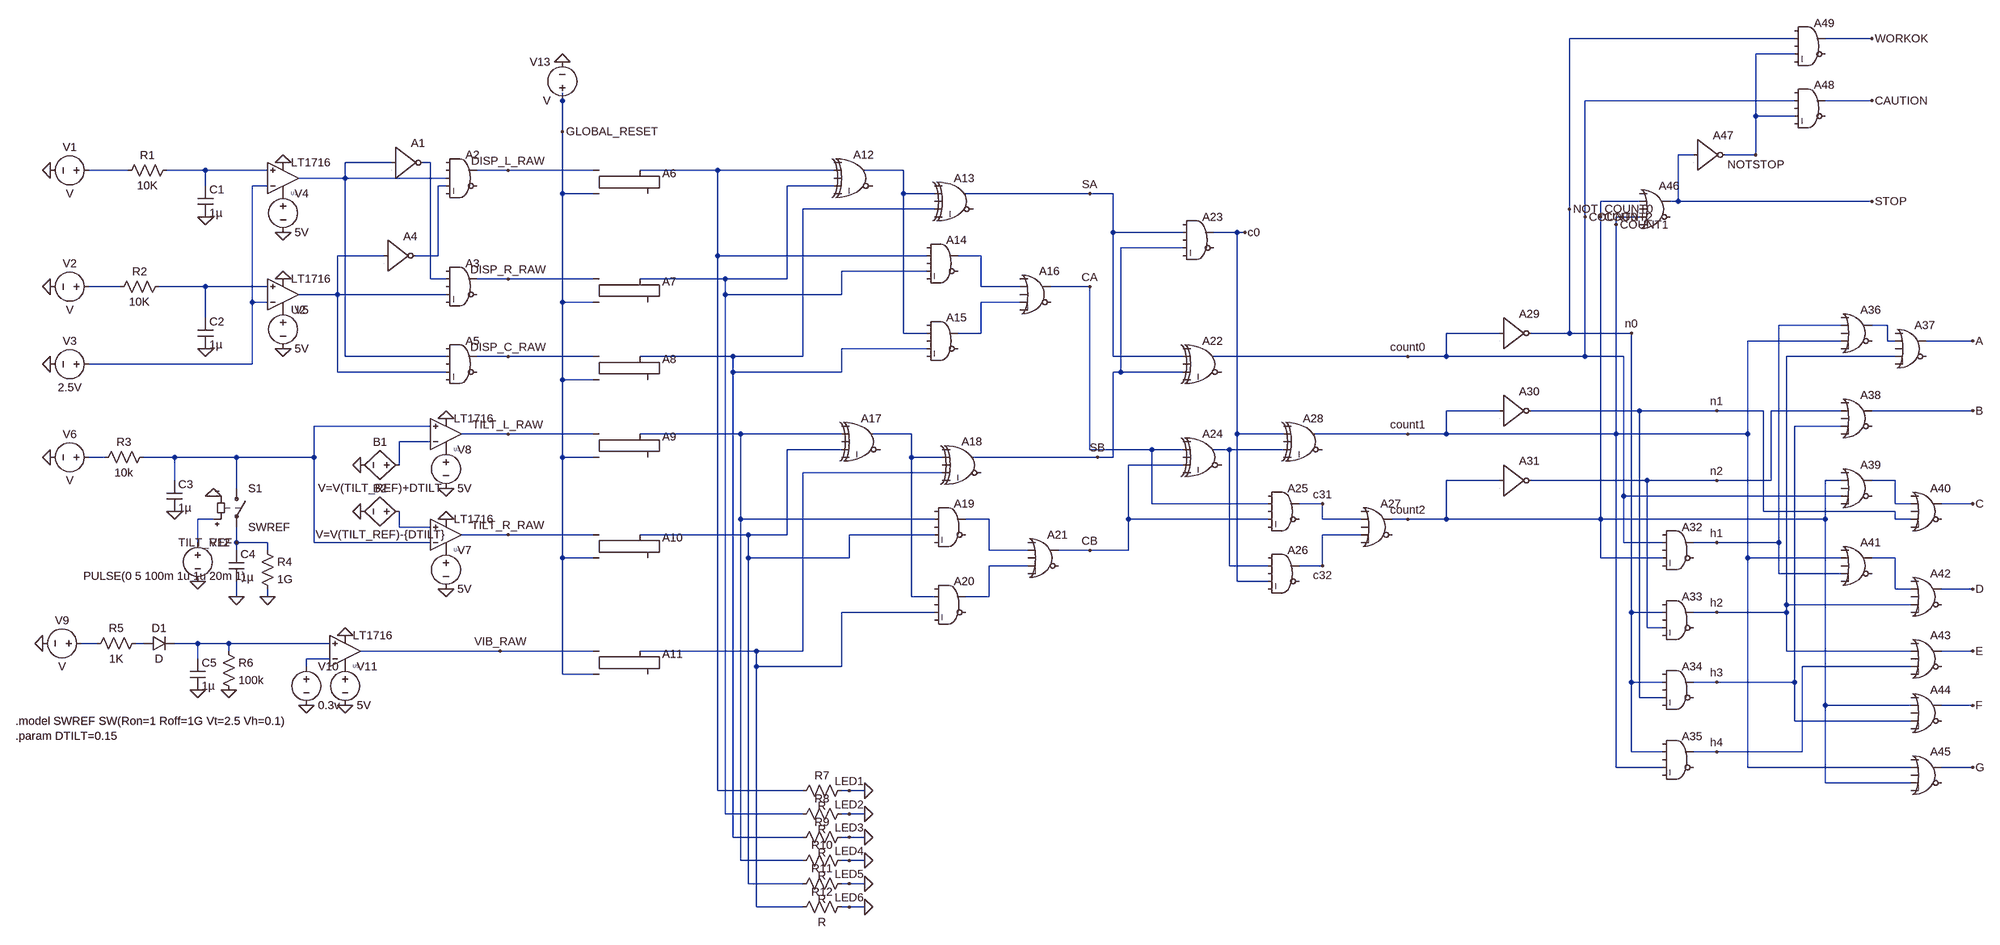
[diagram p0: schematic risk_circuit.asc]
risk_circuit.asc, the LTspice schematic file:
Version 4.1
SHEET 1 4020 1556
WIRE 3632 -272 3168 -272
WIRE 3792 -272 3696 -272
WIRE 3632 -240 3552 -240
WIRE 992 -144 992 -160
WIRE 3632 -144 3200 -144
WIRE 3792 -144 3696 -144
WIRE 3552 -112 3552 -240
WIRE 3632 -112 3552 -112
WIRE 992 -80 992 -144
WIRE 3424 -32 3392 -32
WIRE 3552 -32 3552 -112
WIRE 3552 -32 3488 -32
WIRE 640 -16 544 -16
WIRE 720 -16 704 -16
WIRE 96 0 16 0
WIRE 256 0 176 0
WIRE 384 0 256 0
WIRE 880 0 816 0
WIRE 1056 0 880 0
WIRE 1312 0 1152 0
WIRE 1552 0 1312 0
WIRE 1696 0 1616 0
WIRE 544 16 544 -16
WIRE 544 16 448 16
WIRE 752 16 544 16
WIRE 256 32 256 0
WIRE 384 32 352 32
WIRE 752 32 736 32
WIRE 1552 32 1456 32
WIRE 992 48 992 -80
WIRE 1056 48 992 48
WIRE 1696 48 1696 0
WIRE 1760 48 1696 48
WIRE 2080 48 1824 48
WIRE 2128 48 2080 48
WIRE 3312 64 3232 64
WIRE 3392 64 3392 -32
WIRE 3392 64 3376 64
WIRE 3792 64 3392 64
WIRE 1760 80 1488 80
WIRE 3168 80 3168 -272
WIRE 3200 96 3200 -144
WIRE 3232 96 3232 64
WIRE 3312 96 3264 96
WIRE 3264 112 3264 96
WIRE 2128 128 2128 48
WIRE 2272 128 2128 128
WIRE 2384 128 2336 128
WIRE 2400 128 2384 128
WIRE 2272 160 2144 160
WIRE 624 176 528 176
WIRE 736 176 736 32
WIRE 736 176 688 176
WIRE 1312 176 1312 0
WIRE 1744 176 1312 176
WIRE 1856 176 1808 176
WIRE 1744 208 1568 208
WIRE 720 224 720 -16
WIRE 752 224 720 224
WIRE 880 224 816 224
WIRE 1056 224 880 224
WIRE 1328 224 1152 224
WIRE 1456 224 1456 32
WIRE 1456 224 1328 224
WIRE 80 240 16 240
WIRE 256 240 160 240
WIRE 384 240 256 240
WIRE 1856 240 1856 176
WIRE 1936 240 1856 240
WIRE 2080 240 2000 240
WIRE 528 256 528 176
WIRE 528 256 448 256
WIRE 752 256 528 256
WIRE 1328 256 1328 224
WIRE 1568 256 1568 208
WIRE 1568 256 1328 256
WIRE 352 272 352 32
WIRE 384 272 352 272
WIRE 992 272 992 48
WIRE 1056 272 992 272
WIRE 1936 272 1856 272
WIRE 256 304 256 240
WIRE 3728 320 3600 320
WIRE 3824 320 3792 320
WIRE 1696 336 1696 48
WIRE 1744 336 1696 336
WIRE 1856 336 1856 272
WIRE 1856 336 1808 336
WIRE 3024 336 2816 336
WIRE 3168 336 3168 80
WIRE 3168 336 3088 336
WIRE 3296 336 3168 336
WIRE 3728 352 3536 352
WIRE 3824 352 3824 320
WIRE 3840 352 3824 352
WIRE 4000 352 3904 352
WIRE 1744 368 1568 368
WIRE 544 384 544 16
WIRE 752 384 544 384
WIRE 880 384 816 384
WIRE 1056 384 880 384
WIRE 1344 384 1152 384
WIRE 1488 384 1488 80
WIRE 1488 384 1344 384
WIRE 2128 384 2128 128
WIRE 2272 384 2128 384
WIRE 2736 384 2336 384
WIRE 2816 384 2816 336
WIRE 2816 384 2736 384
WIRE 3200 384 3200 96
WIRE 3200 384 2816 384
WIRE 3280 384 3200 384
WIRE 3840 384 3616 384
WIRE 352 400 352 272
WIRE 352 400 16 400
WIRE 528 416 528 256
WIRE 752 416 528 416
WIRE 1344 416 1344 384
WIRE 1568 416 1568 368
WIRE 1568 416 1344 416
WIRE 2144 416 2144 160
WIRE 2144 416 2128 416
WIRE 2272 416 2144 416
WIRE 992 432 992 272
WIRE 1056 432 992 432
WIRE 3024 496 2816 496
WIRE 3312 496 3088 496
WIRE 3472 496 3312 496
WIRE 3568 496 3472 496
WIRE 3728 496 3584 496
WIRE 4000 496 3792 496
WIRE 720 528 480 528
WIRE 3728 528 3632 528
WIRE 880 544 784 544
WIRE 1056 544 880 544
WIRE 1360 544 1152 544
WIRE 1568 544 1360 544
WIRE 1712 544 1632 544
WIRE 2384 544 2384 128
WIRE 2480 544 2384 544
WIRE 2736 544 2544 544
WIRE 2816 544 2816 496
WIRE 2816 544 2736 544
WIRE 3264 544 3264 112
WIRE 3264 544 2816 544
WIRE 3536 544 3536 352
WIRE 3536 544 3264 544
WIRE 720 560 656 560
WIRE 1568 576 1456 576
WIRE 2080 576 2080 240
WIRE 2208 576 2080 576
WIRE 2272 576 2208 576
WIRE 2368 576 2336 576
WIRE 2480 576 2368 576
WIRE 48 592 16 592
WIRE 192 592 128 592
WIRE 320 592 192 592
WIRE 480 592 480 528
WIRE 480 592 320 592
WIRE 992 592 992 432
WIRE 1056 592 992 592
WIRE 1712 592 1712 544
WIRE 1776 592 1712 592
WIRE 2096 592 1840 592
WIRE 2128 592 2128 416
WIRE 2128 592 2096 592
WIRE 656 608 656 560
WIRE 2272 608 2160 608
WIRE 1776 624 1488 624
WIRE 192 640 192 592
WIRE 3024 640 2816 640
WIRE 3328 640 3088 640
WIRE 3472 640 3328 640
WIRE 3584 640 3584 496
WIRE 3584 640 3472 640
WIRE 3728 640 3696 640
WIRE 3840 640 3792 640
WIRE 320 656 320 592
WIRE 3280 672 3280 384
WIRE 3728 672 3280 672
WIRE 2208 688 2208 576
WIRE 2448 688 2208 688
WIRE 2560 688 2512 688
WIRE 3840 688 3840 640
WIRE 3872 688 3840 688
WIRE 4000 688 3936 688
WIRE 3568 704 3568 496
WIRE 3840 704 3568 704
WIRE 272 720 240 720
WIRE 1360 720 1360 544
WIRE 1760 720 1360 720
WIRE 1872 720 1824 720
WIRE 2160 720 2160 608
WIRE 2448 720 2160 720
WIRE 2560 720 2560 688
WIRE 2640 720 2560 720
WIRE 2736 720 2704 720
WIRE 2816 720 2816 640
WIRE 2816 720 2736 720
WIRE 3232 720 3232 96
WIRE 3232 720 2816 720
WIRE 3696 720 3696 640
WIRE 3696 720 3232 720
WIRE 3840 720 3840 704
WIRE 3872 720 3840 720
WIRE 656 736 656 704
WIRE 720 736 656 736
WIRE 880 752 784 752
WIRE 1056 752 880 752
WIRE 1376 752 1152 752
WIRE 1456 752 1456 576
WIRE 1456 752 1376 752
WIRE 1760 752 1584 752
WIRE 2640 752 2560 752
WIRE 240 768 240 720
WIRE 320 768 320 736
WIRE 384 768 320 768
WIRE 480 768 480 592
WIRE 720 768 480 768
WIRE 3280 768 3280 672
WIRE 3360 768 3280 768
WIRE 3472 768 3424 768
WIRE 3600 768 3600 320
WIRE 3600 768 3472 768
WIRE 320 784 320 768
WIRE 384 784 384 768
WIRE 1872 784 1872 720
WIRE 1952 784 1872 784
WIRE 2080 784 2016 784
WIRE 2160 784 2160 720
WIRE 2160 784 2080 784
WIRE 992 800 992 592
WIRE 1056 800 992 800
WIRE 1376 800 1376 752
WIRE 1584 800 1584 752
WIRE 1584 800 1376 800
WIRE 3232 800 3232 720
WIRE 3360 800 3232 800
WIRE 3536 800 3536 544
WIRE 3728 800 3536 800
WIRE 3840 800 3792 800
WIRE 1952 816 1872 816
WIRE 2368 816 2368 576
WIRE 2448 816 2368 816
WIRE 2560 816 2560 752
WIRE 2560 816 2512 816
WIRE 3600 832 3600 768
WIRE 3728 832 3600 832
WIRE 2384 848 2384 544
WIRE 2448 848 2384 848
WIRE 3840 864 3840 800
WIRE 3872 864 3840 864
WIRE 4000 864 3936 864
WIRE 320 880 320 848
WIRE 384 880 384 864
WIRE 1712 880 1712 592
WIRE 1760 880 1712 880
WIRE 1872 880 1872 816
WIRE 1872 880 1824 880
WIRE 3616 896 3616 384
WIRE 3872 896 3616 896
WIRE 1760 912 1568 912
WIRE 3296 912 3296 336
WIRE 3360 912 3296 912
WIRE 3472 912 3424 912
WIRE 3616 912 3616 896
WIRE 3616 912 3472 912
WIRE 3328 944 3328 640
WIRE 3360 944 3328 944
WIRE 32 976 0 976
WIRE 128 976 112 976
WIRE 240 976 192 976
WIRE 304 976 240 976
WIRE 512 976 304 976
WIRE 304 992 304 976
WIRE 864 992 576 992
WIRE 1056 992 864 992
WIRE 1392 992 1152 992
WIRE 1488 992 1488 624
WIRE 1488 992 1392 992
WIRE 3616 992 3616 912
WIRE 3872 992 3616 992
WIRE 4000 992 3936 992
WIRE 240 1008 240 976
WIRE 512 1008 464 1008
WIRE 464 1024 464 1008
WIRE 1392 1024 1392 992
WIRE 1568 1024 1568 912
WIRE 1568 1024 1392 1024
WIRE 3872 1024 3648 1024
WIRE 992 1040 992 800
WIRE 1056 1040 992 1040
WIRE 3296 1056 3296 912
WIRE 3360 1056 3296 1056
WIRE 3472 1056 3424 1056
WIRE 3632 1056 3632 528
WIRE 3632 1056 3472 1056
WIRE 3312 1088 3312 496
WIRE 3360 1088 3312 1088
WIRE 3696 1104 3696 720
WIRE 3872 1104 3696 1104
WIRE 4000 1104 3936 1104
WIRE 3632 1136 3632 1056
WIRE 3872 1136 3632 1136
WIRE 3296 1200 3296 1056
WIRE 3360 1200 3296 1200
WIRE 3472 1200 3424 1200
WIRE 3648 1200 3648 1024
WIRE 3648 1200 3472 1200
WIRE 3264 1232 3264 544
WIRE 3360 1232 3264 1232
WIRE 3536 1232 3536 800
WIRE 3872 1232 3536 1232
WIRE 4000 1232 3936 1232
WIRE 3696 1264 3696 1104
WIRE 3872 1264 3696 1264
WIRE 1312 1280 1312 176
WIRE 1488 1280 1312 1280
WIRE 1584 1280 1568 1280
WIRE 1616 1280 1584 1280
WIRE 1328 1328 1328 256
WIRE 1488 1328 1328 1328
WIRE 1584 1328 1568 1328
WIRE 1616 1328 1584 1328
WIRE 1344 1376 1344 416
WIRE 1488 1376 1344 1376
WIRE 1584 1376 1568 1376
WIRE 1616 1376 1584 1376
WIRE 1360 1424 1360 720
WIRE 1488 1424 1360 1424
WIRE 1584 1424 1568 1424
WIRE 1616 1424 1584 1424
WIRE 1376 1472 1376 800
WIRE 1488 1472 1376 1472
WIRE 1584 1472 1568 1472
WIRE 1616 1472 1584 1472
WIRE 1392 1520 1392 1024
WIRE 1488 1520 1392 1520
WIRE 1584 1520 1568 1520
WIRE 1616 1520 1584 1520
FLAG -64 0 0
FLAG -64 240 0
FLAG -64 400 0
FLAG 256 368 0
FLAG 256 96 0
FLAG 416 128 0
FLAG 416 368 0
FLAG 416 -16 0
FLAG 416 224 0
FLAG 880 0 DISP_L_RAW
FLAG 880 224 DISP_R_RAW
FLAG 880 384 DISP_C_RAW
FLAG -64 592 0
FLAG 192 704 0
FLAG 320 880 0
FLAG 384 880 0
FLAG 576 608 0
FLAG 576 704 0
FLAG 752 720 0
FLAG 752 512 0
FLAG 464 1104 0
FLAG 544 960 0
FLAG 752 656 0
FLAG 752 864 0
FLAG 240 848 0
FLAG 272 672 0
FLAG 544 1104 0
FLAG -80 976 0
FLAG 240 1072 0
FLAG 304 1072 0
FLAG 864 992 VIB_RAW
FLAG 880 544 TILT_L_RAW
FLAG 880 752 TILT_R_RAW
FLAG 320 768 TILT_REF
FLAG 992 -224 0
FLAG 992 -80 GLOBAL_RESET
FLAG 1584 1280 LED1
FLAG 1584 1328 LED2
FLAG 1584 1376 LED3
FLAG 1584 1424 LED4
FLAG 1584 1472 LED5
FLAG 1584 1520 LED6
FLAG 2080 48 SA
FLAG 2080 240 CA
FLAG 2096 592 SB
FLAG 2080 784 CB
FLAG 2400 128 c0
FLAG 2560 688 c31
FLAG 2560 816 c32
FLAG 2736 384 count0
FLAG 2736 720 count2
FLAG 2736 544 count1
FLAG 3296 336 n0
FLAG 3472 496 n1
FLAG 3472 640 n2
FLAG 3472 768 h1
FLAG 3472 912 h2
FLAG 3472 1056 h3
FLAG 3472 1200 h4
FLAG 4000 352 A
FLAG 4000 496 B
FLAG 4000 688 C
FLAG 4000 864 D
FLAG 4000 992 E
FLAG 4000 1104 F
FLAG 4000 1232 G
FLAG 1616 1280 0
FLAG 1616 1328 0
FLAG 1616 1376 0
FLAG 1616 1424 0
FLAG 1616 1472 0
FLAG 1616 1520 0
FLAG 3792 64 STOP
FLAG 3552 -32 NOTSTOP
FLAG 3792 -144 CAUTION
FLAG 3792 -272 WORKOK
FLAG 3168 80 NOT_COUNT0
FLAG 3200 96 COUNT0
FLAG 3232 96 COUNT2
FLAG 3264 112 COUNT1
SYMBOL voltage 32 0 R90
WINDOW 0 -32 56 VBottom 2
WINDOW 3 32 56 VTop 2
SYMATTR InstName V1
SYMBOL voltage 32 240 R90
WINDOW 0 -32 56 VBottom 2
WINDOW 3 32 56 VTop 2
SYMATTR InstName V2
SYMBOL voltage 32 400 R90
WINDOW 0 -32 56 VBottom 2
WINDOW 3 32 56 VTop 2
WINDOW 123 0 0 Left 0
WINDOW 39 0 0 Left 0
SYMATTR InstName V3
SYMATTR Value 2.5V
SYMBOL res 192 -16 R90
WINDOW 0 0 56 VBottom 2
WINDOW 3 32 56 VTop 2
SYMATTR InstName R1
SYMATTR Value 10K
SYMBOL res 176 224 R90
WINDOW 0 0 56 VBottom 2
WINDOW 3 32 56 VTop 2
SYMATTR InstName R2
SYMATTR Value 10K
SYMBOL cap 240 32 R0
SYMATTR InstName C1
SYMATTR Value 1µ
SYMBOL cap 240 304 R0
SYMATTR InstName C2
SYMATTR Value 1µ
SYMBOL Comparators\\LT1716 416 16 M180
WINDOW 0 16 -32 Left 0
SYMATTR InstName U1
SYMBOL Comparators\\LT1716 416 256 M180
SYMATTR InstName U2
SYMBOL voltage 416 32 R0
WINDOW 123 0 0 Left 0
WINDOW 39 0 0 Left 0
SYMATTR InstName V4
SYMATTR Value 5V
SYMBOL voltage 416 272 R0
WINDOW 123 0 0 Left 0
WINDOW 39 0 0 Left 0
SYMATTR InstName V5
SYMATTR Value 5V
SYMBOL Digital\\inv 640 -80 R0
SYMATTR InstName A1
SYMBOL Digital\\and 784 -48 R0
SYMATTR InstName A2
SYMBOL Digital\\and 784 176 R0
SYMATTR InstName A3
SYMBOL Digital\\inv 624 112 R0
SYMATTR InstName A4
SYMBOL Digital\\and 784 336 R0
SYMATTR InstName A5
SYMBOL voltage 32 592 R90
WINDOW 0 -32 56 VBottom 2
WINDOW 3 32 56 VTop 2
SYMATTR InstName V6
SYMBOL res 144 576 R90
WINDOW 0 0 56 VBottom 2
WINDOW 3 32 56 VTop 2
SYMATTR InstName R3
SYMATTR Value 10k
SYMBOL cap 176 640 R0
SYMATTR InstName C3
SYMATTR Value 1µ
SYMBOL sw 320 640 R0
SYMATTR InstName S1
SYMATTR Value SWREF
SYMBOL cap 304 784 R0
SYMATTR InstName C4
SYMATTR Value 1µ
SYMBOL res 368 768 R0
SYMATTR InstName R4
SYMATTR Value 1G
SYMBOL bv 672 608 R90
WINDOW 0 -32 56 VBottom 2
WINDOW 3 32 56 VTop 2
SYMATTR InstName B1
SYMATTR Value V=V(TILT_REF)+DTILT
SYMBOL bv 672 704 R90
WINDOW 0 -32 56 VBottom 2
WINDOW 3 32 56 VTop 2
SYMATTR InstName B2
SYMATTR Value V=V(TILT_REF)-{DTILT}
SYMBOL Comparators\\LT1716 752 544 M180
WINDOW 0 16 -32 Left 0
SYMATTR InstName U3
SYMBOL Comparators\\LT1716 752 752 M180
WINDOW 0 16 -32 Left 0
SYMATTR InstName U4
SYMBOL voltage 752 768 R0
WINDOW 123 0 0 Left 0
WINDOW 39 0 0 Left 0
SYMATTR InstName V7
SYMATTR Value 5V
SYMBOL voltage 752 560 R0
WINDOW 123 0 0 Left 0
WINDOW 39 0 0 Left 0
SYMATTR InstName V8
SYMATTR Value 5V
SYMBOL voltage 16 976 R90
WINDOW 0 -32 56 VBottom 2
WINDOW 3 32 56 VTop 2
SYMATTR InstName V9
SYMBOL res 128 960 R90
WINDOW 0 0 56 VBottom 2
WINDOW 3 32 56 VTop 2
SYMATTR InstName R5
SYMATTR Value 1K
SYMBOL diode 128 992 R270
WINDOW 0 32 32 VTop 2
WINDOW 3 0 32 VBottom 2
SYMATTR InstName D1
SYMBOL cap 224 1008 R0
SYMATTR InstName C5
SYMATTR Value 1µ
SYMBOL res 288 976 R0
SYMATTR InstName R6
SYMATTR Value 100k
SYMBOL Comparators\\LT1716 544 992 M180
WINDOW 0 16 -32 Left 0
SYMATTR InstName U5
SYMBOL voltage 464 1008 R0
WINDOW 123 0 0 Left 0
WINDOW 39 0 0 Left 0
SYMATTR InstName V10
SYMATTR Value 0.3v
SYMBOL voltage 544 1008 R0
WINDOW 123 0 0 Left 0
WINDOW 39 0 0 Left 0
SYMATTR InstName V11
SYMATTR Value 5V
SYMBOL voltage 240 752 R0
WINDOW 3 -236 85 Left 2
WINDOW 123 0 0 Left 0
WINDOW 39 0 0 Left 0
SYMATTR Value PULSE(0 5 100m 1u 1u 20m 1)
SYMATTR InstName V12
SYMBOL Digital\\srflop 1104 -48 R0
SYMATTR InstName A6
SYMBOL Digital\\srflop 1104 176 R0
SYMATTR InstName A7
SYMBOL Digital\\srflop 1104 336 R0
SYMATTR InstName A8
SYMBOL Digital\\srflop 1104 496 R0
SYMATTR InstName A9
SYMBOL Digital\\srflop 1104 704 R0
SYMATTR InstName A10
SYMBOL Digital\\srflop 1104 944 R0
SYMATTR InstName A11
SYMBOL voltage 992 -128 R180
WINDOW 0 24 96 Left 2
WINDOW 3 24 16 Left 2
SYMATTR InstName V13
SYMBOL res 1584 1264 R90
WINDOW 0 0 56 VBottom 2
WINDOW 3 32 56 VTop 2
SYMATTR InstName R7
SYMBOL res 1584 1312 R90
WINDOW 0 0 56 VBottom 2
WINDOW 3 32 56 VTop 2
SYMATTR InstName R8
SYMBOL res 1584 1360 R90
WINDOW 0 0 56 VBottom 2
WINDOW 3 32 56 VTop 2
SYMATTR InstName R9
SYMBOL res 1584 1408 R90
WINDOW 0 0 56 VBottom 2
WINDOW 3 32 56 VTop 2
SYMATTR InstName R10
SYMBOL res 1584 1456 R90
WINDOW 0 0 56 VBottom 2
WINDOW 3 32 56 VTop 2
SYMATTR InstName R11
SYMBOL res 1584 1504 R90
WINDOW 0 0 56 VBottom 2
WINDOW 3 32 56 VTop 2
SYMATTR InstName R12
SYMBOL Digital\\xor 1600 -48 R0
SYMATTR InstName A12
SYMBOL Digital\\xor 1808 0 R0
SYMATTR InstName A13
SYMBOL Digital\\and 1776 128 R0
SYMATTR InstName A14
SYMBOL Digital\\and 1776 288 R0
SYMATTR InstName A15
SYMBOL Digital\\or 1968 192 R0
SYMATTR InstName A16
SYMBOL Digital\\xor 1616 496 R0
SYMATTR InstName A17
SYMBOL Digital\\xor 1824 544 R0
SYMATTR InstName A18
SYMBOL Digital\\and 1792 672 R0
SYMATTR InstName A19
SYMBOL Digital\\and 1792 832 R0
SYMATTR InstName A20
SYMBOL Digital\\or 1984 736 R0
SYMATTR InstName A21
SYMBOL Digital\\xor 2320 336 R0
SYMATTR InstName A22
SYMBOL Digital\\and 2304 80 R0
SYMATTR InstName A23
SYMBOL Digital\\xor 2320 528 R0
SYMATTR InstName A24
SYMBOL Digital\\and 2480 640 R0
SYMATTR InstName A25
SYMBOL Digital\\and 2480 768 R0
SYMATTR InstName A26
SYMBOL Digital\\or 2672 672 R0
SYMATTR InstName A27
SYMBOL Digital\\xor 2528 496 R0
SYMATTR InstName A28
SYMBOL Digital\\inv 3024 272 R0
SYMATTR InstName A29
SYMBOL Digital\\inv 3024 432 R0
SYMATTR InstName A30
SYMBOL Digital\\inv 3024 576 R0
SYMATTR InstName A31
SYMBOL Digital\\and 3392 720 R0
SYMATTR InstName A32
SYMBOL Digital\\and 3392 864 R0
SYMATTR InstName A33
SYMBOL Digital\\and 3392 1008 R0
SYMATTR InstName A34
SYMBOL Digital\\and 3392 1152 R0
SYMATTR InstName A35
SYMBOL Digital\\or 3760 272 R0
SYMATTR InstName A36
SYMBOL Digital\\or 3872 304 R0
SYMATTR InstName A37
SYMBOL Digital\\or 3760 448 R0
SYMATTR InstName A38
SYMBOL Digital\\or 3760 592 R0
SYMATTR InstName A39
SYMBOL Digital\\or 3904 640 R0
SYMATTR InstName A40
SYMBOL Digital\\or 3760 752 R0
SYMATTR InstName A41
SYMBOL Digital\\or 3904 816 R0
SYMATTR InstName A42
SYMBOL Digital\\or 3904 944 R0
SYMATTR InstName A43
SYMBOL Digital\\or 3904 1056 R0
SYMATTR InstName A44
SYMBOL Digital\\or 3904 1184 R0
SYMATTR InstName A45
SYMBOL Digital\\or 3344 16 R0
SYMATTR InstName A46
SYMBOL Digital\\inv 3424 -96 R0
SYMATTR InstName A47
SYMBOL Digital\\and 3664 -192 R0
SYMATTR InstName A48
SYMBOL Digital\\and 3664 -320 R0
SYMATTR InstName A49
TEXT -136 1136 Left 2 !.model SWREF SW(Ron=1 Roff=1G Vt=2.5 Vh=0.1)\n.param DTILT=0.15

The netlist it stands for:
* risk_circuit.asc
V1 N003 0 V
V2 N013 0 V
V3 N007 0 2.5V
R1 N004 N003 10K
R2 N014 N013 10K
C1 N004 0 1µ
C2 N014 0 1µ
X§U1 N004 N007 P001 0 N001 LT1716  ; pins In+ In- V+ V- OUT
X§U2 N014 N007 P002 0 N011 LT1716  ; pins In+ In- V+ V- OUT
V4 P001 0 5V
V5 P002 0 5V
A1 N001 0 0 0 0 N002 0 0 BUF
A2 0 0 N001 N008 0 0 DISP_L_RAW 0 AND
A3 0 N002 0 N011 0 0 DISP_R_RAW 0 AND
A4 N011 0 0 0 0 N008 0 0 BUF
A5 0 N001 0 N011 0 0 DISP_C_RAW 0 AND
V6 N023 0 V
R3 N017 N023 10k
C3 N017 0 1µ
S1 N017 TILT_REF N026 0 SWREF
C4 TILT_REF 0 1µ
R4 TILT_REF 0 1G
B1 N020 0 V=V(TILT_REF)+DTILT
B2 N028 0 V=V(TILT_REF)-{DTILT}
X§U3 N017 N020 P003 0 TILT_L_RAW LT1716  ; pins In+ In- V+ V- OUT
X§U4 N028 N017 P004 0 TILT_R_RAW LT1716  ; pins In+ In- V+ V- OUT
V7 P004 0 5V
V8 P003 0 5V
V9 N031 0 V
R5 N032 N031 1K
D1 N032 N033 D
C5 N033 0 1µ
R6 N033 0 100k
X§U5 N033 N034 P005 0 VIB_RAW LT1716  ; pins In+ In- V+ V- OUT
V10 N034 0 0.3v
V11 P005 0 5V
V12 N026 0 PULSE(0 5 100m 1u 1u 20m 1)
A6 DISP_L_RAW GLOBAL_RESET 0 0 0 0 N005 0 SRFLOP
A7 DISP_R_RAW GLOBAL_RESET 0 0 0 0 N009 0 SRFLOP
A8 DISP_C_RAW GLOBAL_RESET 0 0 0 0 N010 0 SRFLOP
A9 TILT_L_RAW GLOBAL_RESET 0 0 0 0 N018 0 SRFLOP
A10 TILT_R_RAW GLOBAL_RESET 0 0 0 0 N021 0 SRFLOP
A11 VIB_RAW GLOBAL_RESET 0 0 0 0 N024 0 SRFLOP
V13 GLOBAL_RESET 0 V
R7 0 N005 R
R8 0 N009 R
R9 0 N010 R
R10 0 N018 R
R11 0 N021 R
R12 0 N024 R
A12 0 N005 0 N009 0 0 N006 0 XOR
A13 0 N006 0 N010 0 0 SA 0 XOR
A14 0 N005 0 N009 0 0 N012 0 AND
A15 0 N006 0 N010 0 0 N015 0 AND
A16 0 N012 0 N015 0 0 CA 0 OR
A17 0 N018 0 N021 0 0 N019 0 XOR
A18 0 N019 0 N024 0 0 SB 0 XOR
A19 0 N018 0 N021 0 0 N027 0 AND
A20 0 N019 0 N024 0 0 N030 0 AND
A21 0 N027 0 N030 0 0 CB 0 OR
A22 0 SA 0 SB 0 0 count0 0 XOR
A23 0 SA 0 SB 0 0 c0 0 AND
A24 0 CA 0 CB 0 0 N022 0 XOR
A25 0 CA 0 CB 0 0 c31 0 AND
A26 0 N022 0 c0 0 0 c32 0 AND
A27 0 c31 0 c32 0 0 count2 0 OR
A28 0 c0 0 N022 0 0 count1 0 XOR
A29 count0 0 0 0 0 NOT_COUNT0 0 0 BUF
A30 count1 0 0 0 0 n1 0 0 BUF
A31 count2 0 0 0 0 n2 0 0 BUF
A32 0 count0 0 count2 0 0 h1 0 AND
A33 0 NOT_COUNT0 0 n2 0 0 h2 0 AND
A34 0 NOT_COUNT0 0 n1 0 0 h3 0 AND
A35 0 NOT_COUNT0 0 count1 0 0 h4 0 AND
A36 0 h1 0 count1 0 0 N016 0 OR
A37 0 N016 0 h2 0 0 A 0 OR
A38 0 n2 0 h3 0 0 B 0 OR
A39 0 count2 0 count0 0 0 N025 0 OR
A40 0 N025 0 n1 0 0 C 0 OR
A41 0 count1 0 h1 0 0 N029 0 OR
A42 0 N029 0 h2 0 0 D 0 OR
A43 0 h2 0 h4 0 0 E 0 OR
A44 0 count2 0 h3 0 0 F 0 OR
A45 0 count1 0 count2 0 0 G 0 OR
A46 0 count2 0 count1 0 0 STOP 0 OR
A47 STOP 0 0 0 0 NOTSTOP 0 0 BUF
A48 0 count0 0 NOTSTOP 0 0 CAUTION 0 AND
A49 0 NOT_COUNT0 0 NOTSTOP 0 0 WORKOK 0 AND
.model D D
.lib standard.dio
.model SWREF SW(Ron=1 Roff=1G Vt=2.5 Vh=0.1)
.param DTILT=0.15
.lib LTC1.lib
.backanno
.end